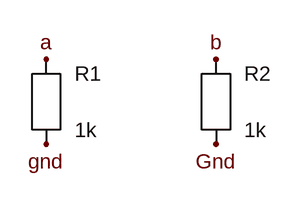
[diagram p0: schematic gnd_label_lower_case.asc]
gnd_label_lower_case.asc, the LTspice schematic file:
Version 4
SHEET 1 880 680
FLAG 96 96 a
FLAG 96 192 gnd
FLAG 288 96 b
FLAG 288 192 Gnd
SYMBOL res 96 144 R0
SYMATTR InstName R1
SYMATTR Value 1k
SYMBOL res 288 144 R0
SYMATTR InstName R2
SYMATTR Value 1k

The netlist it stands for:
* gnd_label_lower_case.asc
R1 a gnd 1k
R2 b gnd 1k
.backanno
.end